# Altium schematic sheet Sheet1.SchDoc
size A4; SheetNumber: 1; SheetTotal: 1
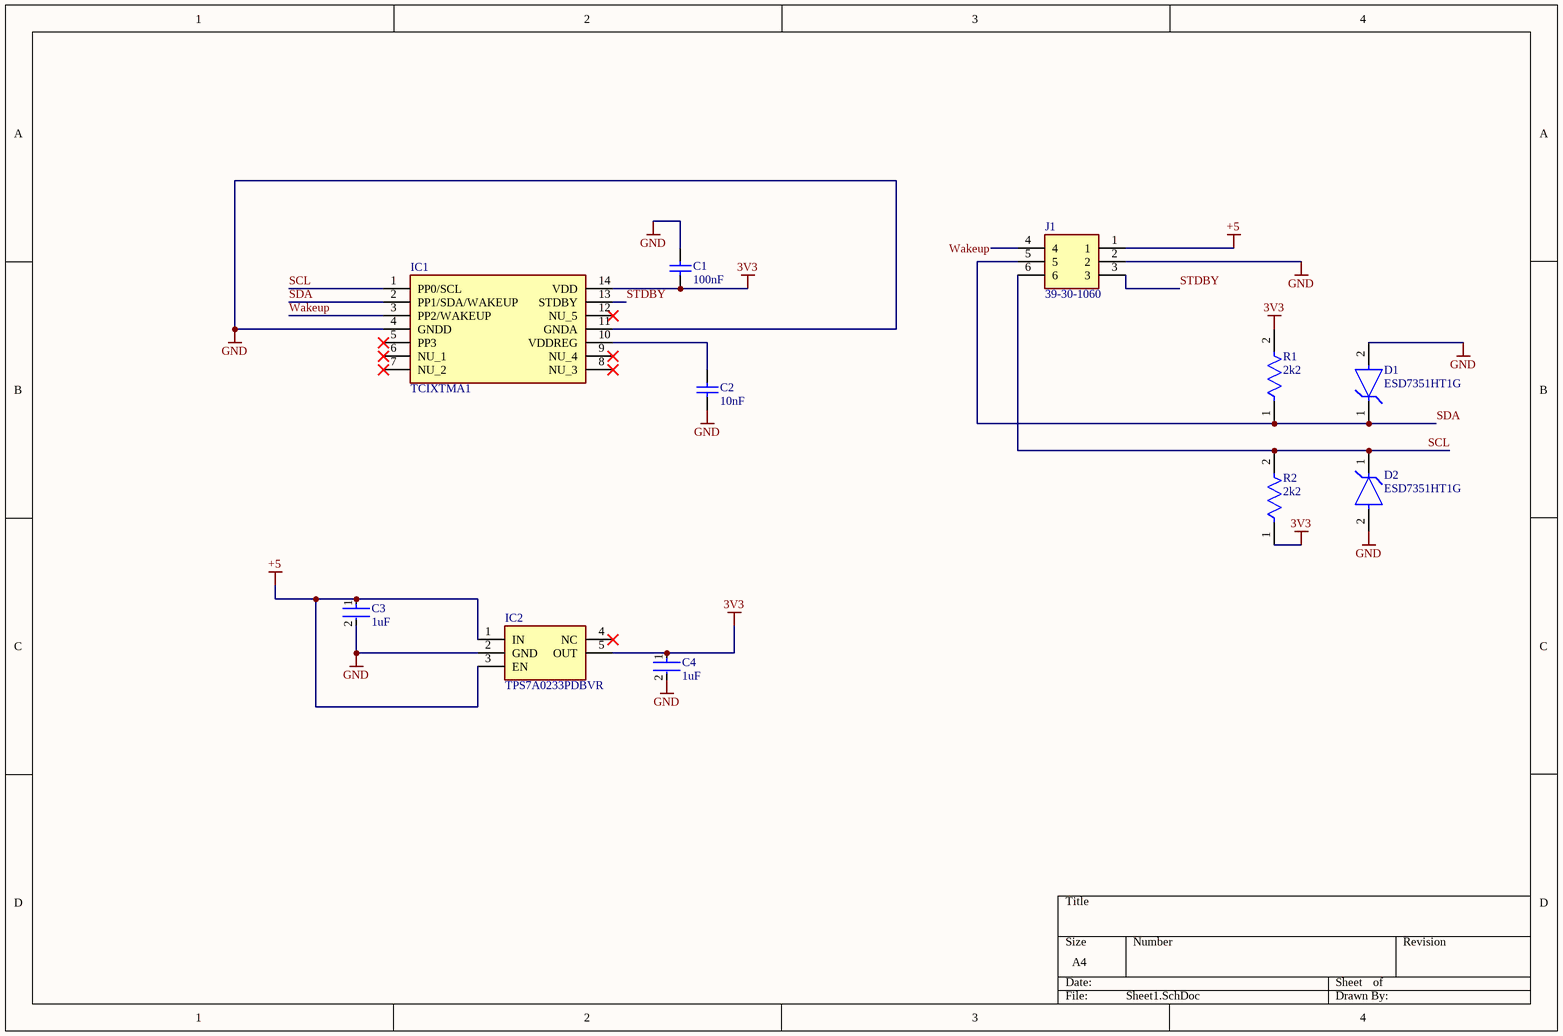
[diagram p0: Sheet1.SchDoc]

## Parts
C1  100nF  [KEMT-1206-2_M]
C2  10nF  [CAPC2013X145X48ML20T23]
C3  1uF  [FP-1206-L_3_2_0_2-W_1_6_0-IPC_B]
C4  1uF  [FP-1206-L_3_2_0_2-W_1_6_0-IPC_B]
D1  ESD7351HT1G  [FP-477-02-MFG]
D2  ESD7351HT1G  [FP-477-02-MFG]
IC1  TCIXTMA1  [SOP65P890X370-14N]
IC2  TPS7A0233PDBVR  [SOT95P280X145-5N]
J1  39-30-1060  [39-30-106Y_012]
R1  2k2  [FP-CRGP0805-IPC_C]
R2  2k2  [FP-CRGP0805-IPC_C]

## Nets
3V3: C1.1 C4.1 IC1.14(VDD) IC2.5(OUT) R1.2 R2.1
+5: C3.1 IC2.1(IN) IC2.3(EN) J1.1
GND: C1.2 C2.1 C3.2 C4.2 D1.2(A) D2.2(A) IC1.4(GNDD) IC1.11(GNDA) IC2.2(GND) J1.2
SCL: D2.1(C) IC1.1(PP0/SCL) J1.6 R2.2
SDA: D1.1(C) IC1.2(PP1/SDA/WAKEUP) J1.5 R1.1
STDBY: IC1.13(STDBY) J1.3
Wakeup: IC1.3(PP2/WAKEUP) J1.4
NetC2_2: C2.2 IC1.10(VDDREG)

Not connected (* = marked no-connect by the designer): IC1 5(PP3)* 6(NU_1)* 7(NU_2)* 8(NU_3)* 9(NU_4)* 12(NU_5)*; IC2 4(NC)*

## Library data of the parts
C1 = CMP-1037-04202-2: CAP, Ceramic, 0.1 uF, +/- 10%, 50 V, -55 to 125 degC, 1206 (3216 Metric), RoHS, Tape and Reel; Manufacturer: Kemet; Voltage Rating: 50V; Capacitance: 0.1µF; Product Range: KEMET-CSeries; SVHC: ToBeAdvised; Dielectric Characteristic: X7R; Capacitor Case Style: 1206[3216Metric]; Package Reference: 1206-2; Package Description: 2-Leads SMD, Body 3.2 x 1.6 mm; Packaging: Tape&Reel; Operating Temperature Max: 125degC; Capacitance Tolerance: ±10%; Datasheet URL: https://datasheet.ciiva.com/6125/1725438-6125494.pdf; Manufacturer URL: http://www.kemet.com/; Operating Temperature Min: -55degC; Datasheet Version: Jul-13
C2 = CMP-2007-01698-1: Part Number: VJ0805Y103KXBMC; Manufacturer: Vitramon
C3 C4 = CMP-04427-010925-1: Automotive Ceramic Capacitor, 1206, 1uF, 5%, X7R, 15%, 50V; Mount: Surface Mount; Min Operating Temperature: -55°C; Voltage Rating (DC): 50V; Ratings: AEC-Q200; Tolerance: 5%; RoHS Compliant: Yes; Max Operating Temperature: 125°C; Width: 0.063inch; Voltage Rating: 50V; Thickness: 0.037inch; Package Quantity: 2000; Capacitance: 1uF; Packaging: Tape and Reel; Length: 0.126inch; Case/Package: 1206; Dielectric: X7R
D1 D2 = CMP-00278-47358424-1: ESD7351HT1G ESD7351 Series 5 V 0.6 pF Uni-Directional ESD Protection Diode - SOD-323; Manufacturer Lifecycle Status: ACTIVE; Clamping Voltage: 10V; Max Junction Temperature (Tj): 150°C; Reverse Standoff Voltage: 3.3V; Direction: Unidirectional; Breakdown Voltage: 5V; Peak Pulse Power: 150mW; Peak Pulse Current: 3A; Power Line Protection: No; Capacitance: 430fF; Number of Unidirectional Channels: 1; Schedule B: 8536300000; Height: 1mm; Case/Package: SOD; Lifecycle Status: Production; Packaging: Tape & Reel (TR); RoHS: Compliant; Min Operating Temperature: -55°C; Composition: Zener; Max Operating Temperature: 150°C; Mount: Surface Mount; Min Breakdown Voltage: 5V; Lead Free: Lead Free; NexarPartId: 47358424; Number of Channels: 1
IC1 = TCIXTMA1: Integrated Circuit; Manufacturer_Name: Infineon; Datasheet Link: https://www.infineon.com/assets/row/public/documents/24/49/infineon-tci-datasheet-en.pdf; Height: 3.7mm; Manufacturer_Part_Number: TCIXTMA1
IC2 = TPS7A0233PDBVR: Integrated Circuit; Manufacturer_Name: Texas Instruments; Datasheet Link: https://www.ti.com/lit/gpn/TPS7A02; Height: 1.45mm; Manufacturer_Part_Number: TPS7A0233PDBVR; Mouser Part Number: 595-TPS7A0233PDBVR; Mouser Price/Stock: https://www.mouser.co.uk/ProductDetail/Texas-Instruments/TPS7A0233PDBVR?qs=OlC7AqGiEDmMDf5GlW%2FWnQ%3D%3D; Arrow Part Number: TPS7A0233PDBVR; Arrow Price/Stock: https://www.arrow.com/en/products/tps7a0233pdbvr/texas-instruments.html?utm_currency=USD&region=nac
J1 = 39-30-1060: Connector; Manufacturer_Name: Molex; Datasheet Link: https://www.molex.com/pdm_docs/sd/039300020_sd.pdf; Height: 10mm; Manufacturer_Part_Number: 39-30-1060; Mouser Part Number: 538-39-30-1060; Mouser Price/Stock: https://www.mouser.co.uk/ProductDetail/Molex/39-30-1060?qs=tRPrwvvr%2FujbUr18ehTIWQ%3D%3D
R1 R2 = CMP-03211-003253-1: CRGP0805 2.2KΩ 0.33W ±100ppm/°C 1% 150V; Manufacturer: TE; Manufacturer Part Number: CRGP0805F2K2; Tolerance: 0.01; Temperature: -55°C to +155°C; Lead Free: Yes; Power Rating: 0.33W; Value: 2.2KΩ; RoHS: TRUE; Ipc Land Pattern Name: RESC200125X55; Temperature Range High: +155°C; ComponentLink2URL: https://www.mouser.com/datasheet/2/418/NG_DS_9-1773463-9_A-1358566.pdf; Temperature Range Low: -55°C; Device Class L1: Passive Components; Ambient Temperature Range High: +70°C; Automotive: No; Device Class L2: Resistors; Height: 0.65mm; Voltage Rating: 150V; ComponentLink2Description: Datasheet; Temperature Coefficient: ±100ppm/°C; Category: Res; Composition: Thick Film; Octopart: https://octopart.com/crgp0805f2k2-te+connectivity-91018809; Device Class L3: Chip SMD Resistors; Resistance: 2.2KΩ; Series: CRGP; Package: CRGP0805